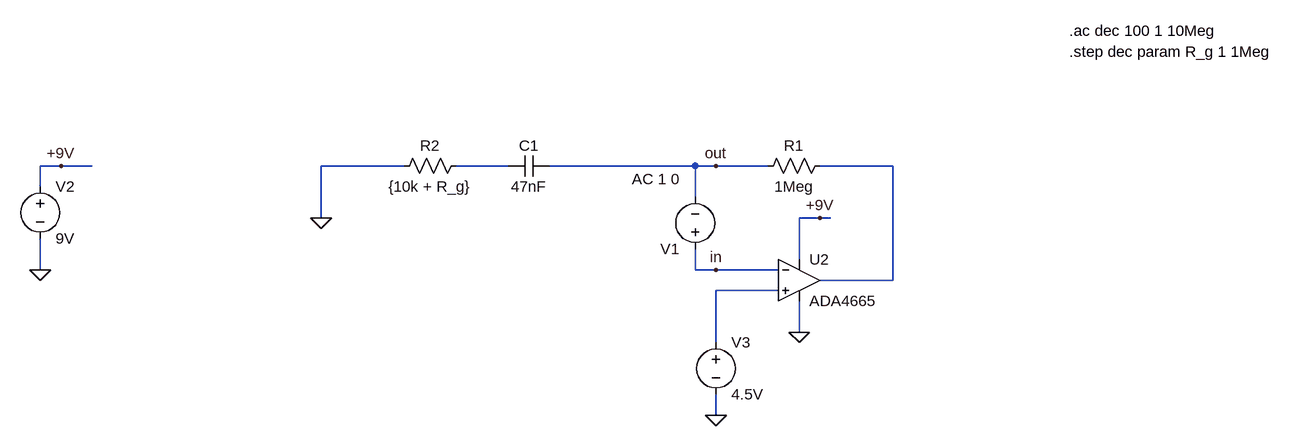
[diagram p0: schematic Distortion_Pedal_Stability.asc]
Distortion_Pedal_Stability.asc, the LTspice schematic file:
Version 4.1
SHEET 1 2068 680
WIRE -640 48 -672 48
WIRE -592 48 -640 48
WIRE -112 48 -240 48
WIRE 48 48 -32 48
WIRE 336 48 112 48
WIRE 368 48 336 48
WIRE 448 48 368 48
WIRE 640 48 528 48
WIRE -672 80 -672 48
WIRE 336 96 336 48
WIRE -240 128 -240 48
WIRE 528 128 496 128
WIRE 544 128 528 128
WIRE 496 192 496 128
WIRE -672 208 -672 160
WIRE 336 208 336 176
WIRE 368 208 336 208
WIRE 464 208 368 208
WIRE 640 224 640 48
WIRE 640 224 528 224
WIRE 464 240 368 240
WIRE 496 304 496 256
WIRE 368 320 368 240
WIRE 368 432 368 400
FLAG 496 304 0
FLAG 528 128 +9V
FLAG -240 128 0
FLAG -672 208 0
FLAG -640 48 +9V
FLAG 368 432 0
FLAG 368 208 in
FLAG 368 48 out
SYMBOL res 544 32 R90
WINDOW 0 0 56 VBottom 2
WINDOW 3 32 56 VTop 2
SYMATTR InstName R1
SYMATTR Value 1Meg
SYMBOL voltage 336 192 R180
WINDOW 123 24 124 Left 2
WINDOW 39 0 0 Left 0
SYMATTR Value2 AC 1 0
SYMATTR InstName V1
SYMATTR Value ""
SYMBOL voltage -672 64 R0
SYMATTR InstName V2
SYMATTR Value 9V
SYMBOL res -16 32 R90
WINDOW 0 0 56 VBottom 2
WINDOW 3 32 56 VTop 2
SYMATTR InstName R2
SYMATTR Value {10k + R_g}
SYMBOL cap 112 32 R90
WINDOW 0 0 32 VBottom 2
WINDOW 3 32 32 VTop 2
SYMATTR InstName C1
SYMATTR Value 47nF
SYMBOL voltage 368 304 R0
WINDOW 123 0 0 Left 0
WINDOW 39 0 0 Left 0
SYMATTR InstName V3
SYMATTR Value 4.5V
SYMBOL OpAmps\\ADA4665 496 160 R0
SYMATTR InstName U2
TEXT 912 -160 Left 2 !.ac dec 100 1 10Meg
TEXT 912 -128 Left 2 !.step dec param R_g 1 1Meg

The netlist it stands for:
* Distortion_Pedal_Stability.asc
R1 N002 out 1Meg
V1 in out AC 1 0
V2 +9V 0 9V
R2 N001 0 {10k + R_g}
C1 out N001 47nF
V3 N003 0 4.5V
X§U2 N003 in +9V 0 N002 ADA4665  ; pins In+ In- V+ V- OUT
.ac dec 100 1 10Meg
.step dec param R_g 1 1Meg
.backanno
.end